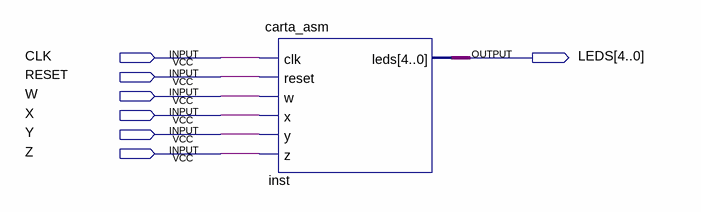
[diagram p0: schematic sheet]
// Quartus schematic P4.bdf as structural Verilog: 1 symbols, 7 pins
module P4 (
  input  CLK,
  input  RESET,
  input  W,
  input  X,
  input  Y,
  input  Z,
  output [4:0] LEDS
);

  carta_asm inst (.clk(CLK), .reset(RESET), .w(W), .x(X), .y(Y), .z(Z), .leds(LEDS));
endmodule
